# Altium schematic sheet Main.SchDoc: ТО2429
size 410 x 297 mm; ApprovedBy: Стерхов В.Д.; CheckedBy: Стерхов В.Д.; Author: Сергеев Д.А.; CompanyName: ГК "СНАБЖЕНИЕ"; DrawnBy: Сергеев Д.А.; Engineer: Сергеев Д.А.; Organization: ГК "СНАБЖЕНИЕ"; DocumentNumber: ТО2429; Revision: 1; SheetNumber: 1; SheetTotal: 2
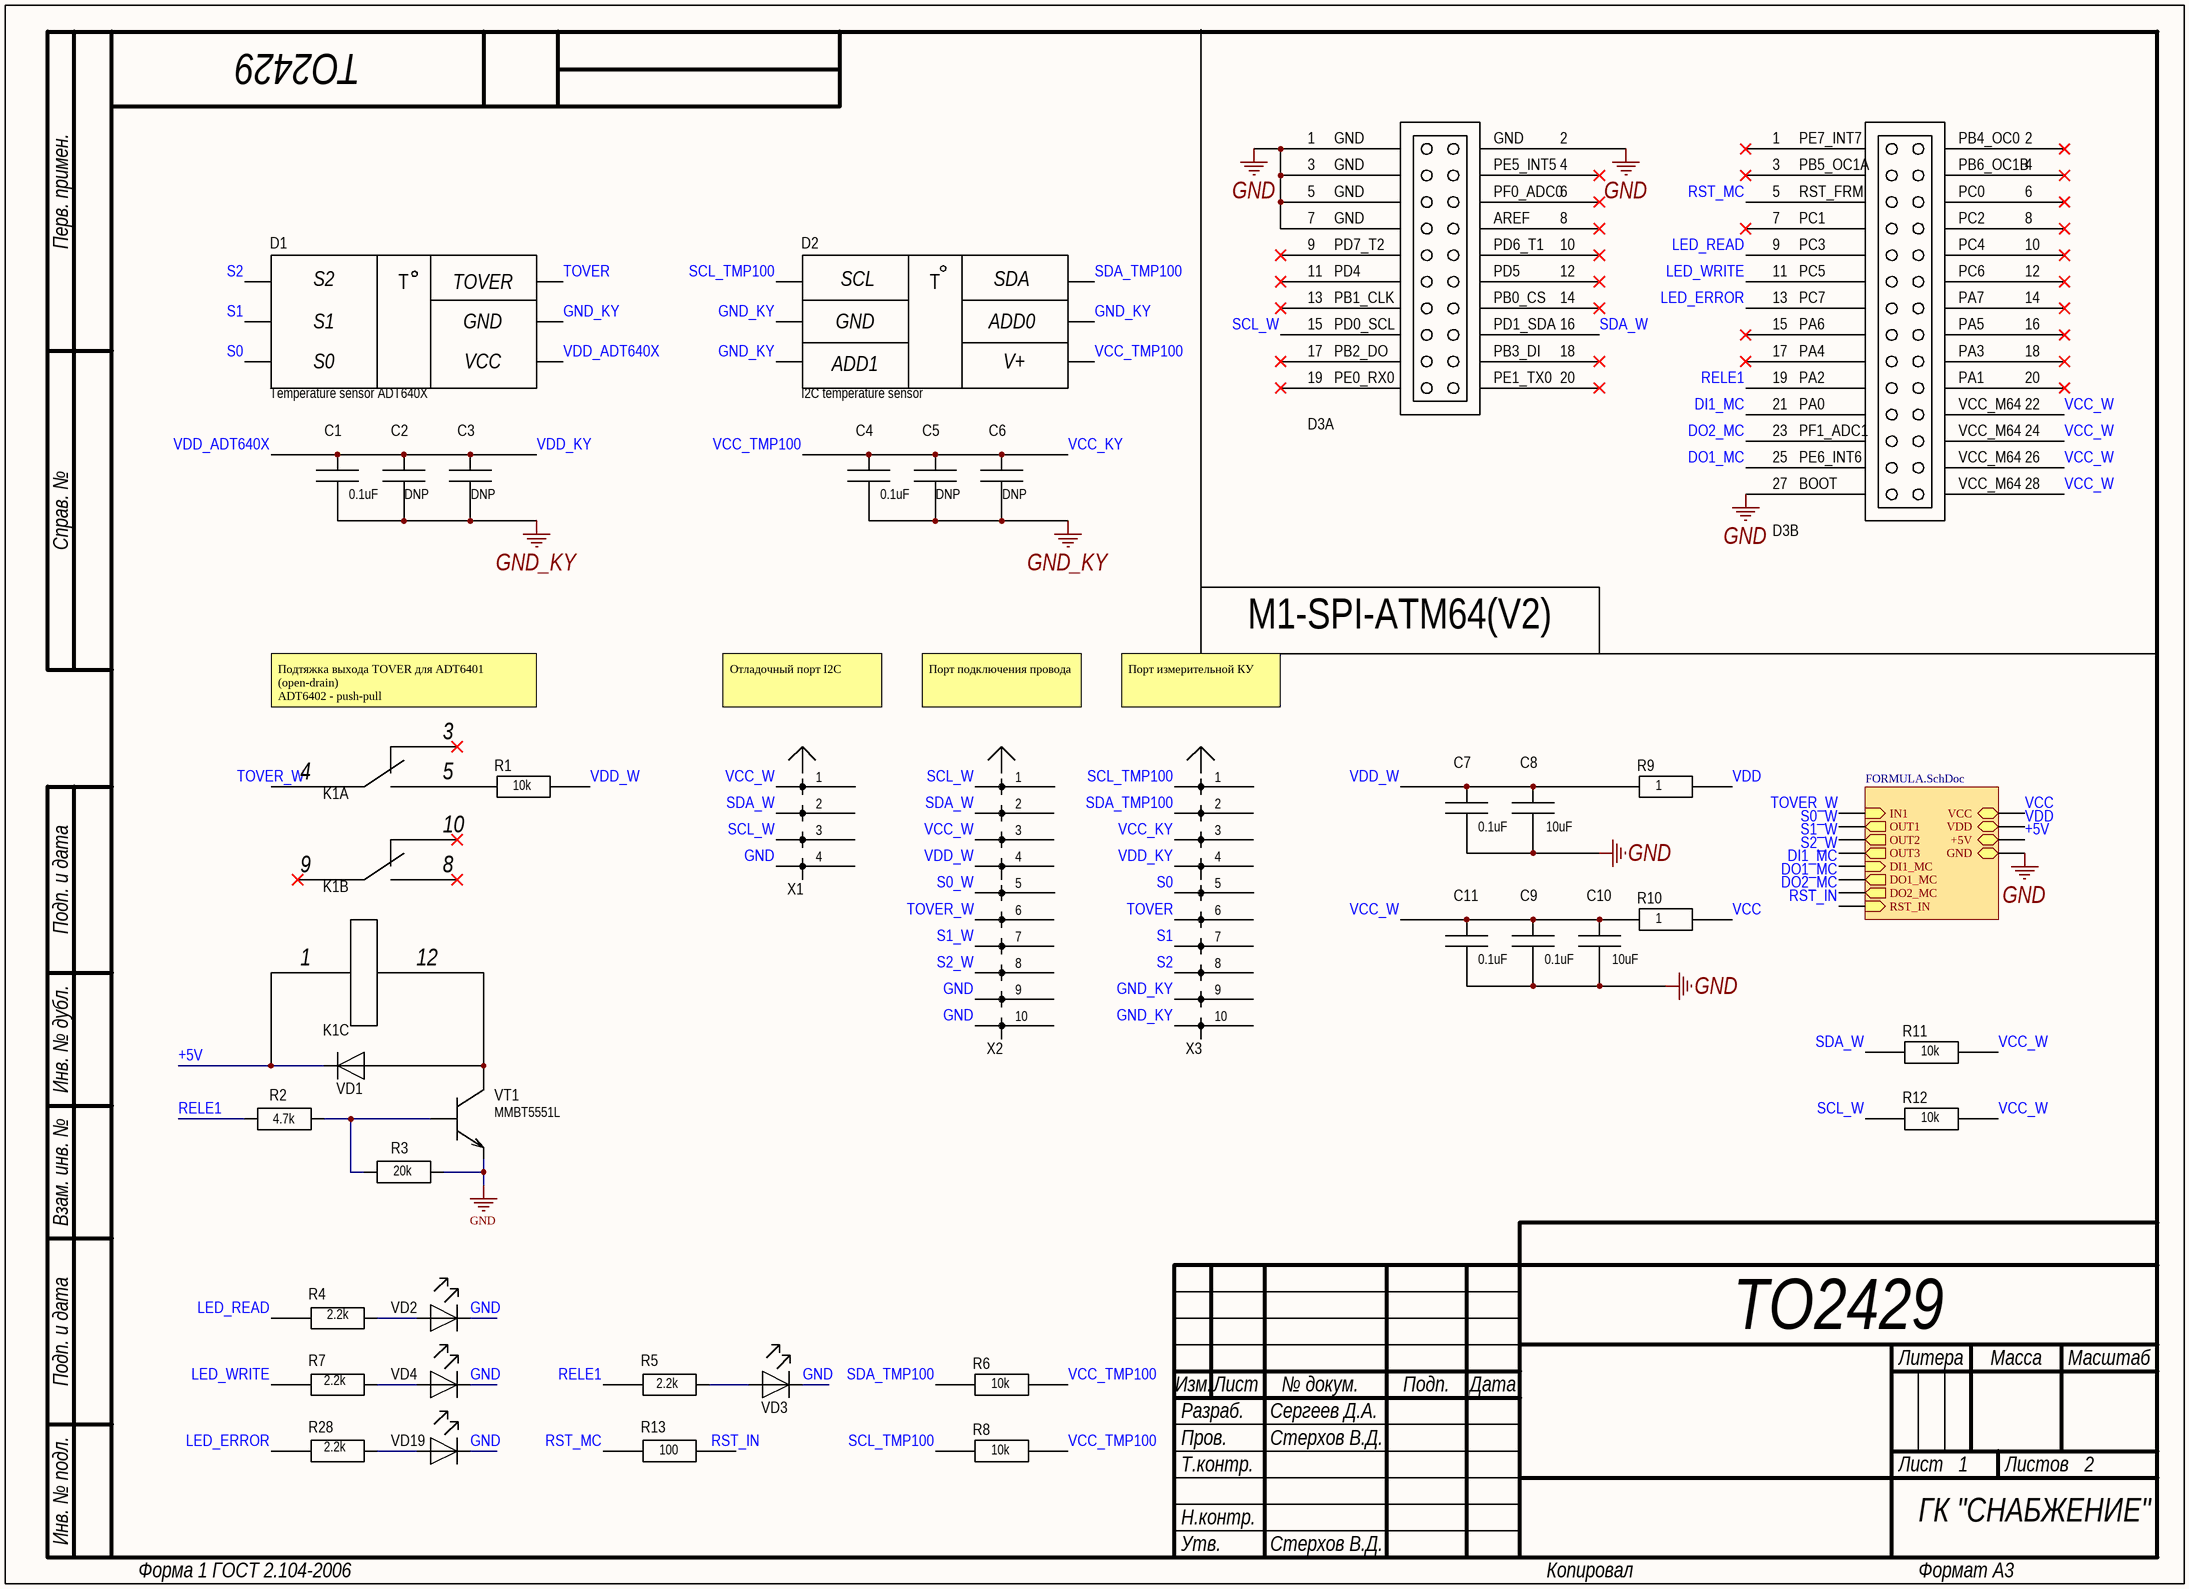
[diagram p0: Main.SchDoc]

## Parts
C1  0.1uF  [0603]
C2  DNP  [0603]
C3  DNP  [0603]
C4  0.1uF  [0603]
C5  DNP  [0603]
C6  DNP  [0603]
C7  0.1uF  [0805]
C8  10uF  [0805]
C9  0.1uF  [0805]
C10  10uF  [0805]
C11  0.1uF  [0805]
D1  Temperature sensor ADT640X  [SOT-23-6 to DIP 7.62]
D2  I2C temperature sensor  [SOT23-6]
D3  M1-SPI-ATM64(V2)  [M1-SPI-ATM64(V2)]  (value not drawn)  (parts A,B of 2)
K1  V23079A1001B301 TE  [V23079A1001B301]  (value not drawn)  (parts A,B,C of 3)
R1  10k  [0805]
R2  4.7k  [0805]
R3  20k  [0805]
R4  2.2k  [0805]
R5  2.2k  [0805]
R6  10k  [0603]
R7  2.2k  [0805]
R8  10k  [0603]
R9  1  [0805]
R10  1  [0805]
R11  10k  [0805]
R12  10k  [0805]
R13  100  [0805]
R28  2.2k  [0805]
VD1  LL4148 NXP  [SOD80C]  (value not drawn)
VD2  LED(0805)  [0805(LED)]  (value not drawn)
VD3  LED(0805)  [0805(LED)]  (value not drawn)
VD4  LED(0805)  [0805(LED)]  (value not drawn)
VD19  LED(0805)  [0805(LED)]  (value not drawn)
VT1  MMBT5551L  [SOT-23]
X1  PLS4-2,54  [PLS4-2,54]  (value not drawn)
X2  PLD10-2,54  [PLD10-2,54]  (value not drawn)
X3  PLD10-2,54  [PLD10-2,54]  (value not drawn)

## Sub-sheets
? = FORMULA.SchDoc: OUT1 (out), VDD (bidir), VCC (bidir), +5V (bidir), OUT3 (out), IN1 (in), OUT2 (out), GND (bidir), DO1_MC (out), DI1_MC (in), DO2_MC (out), RST_IN (in)

## Nets
GND: C7.2 C8.2 C9.2 C10.2 C11.2 D3.1X2 D3.2X2 D3.3X2 D3.5X2 D3.7X2 D3.27X3 R3.2 VD2.2(K) VD3.2(K) VD4.2(K) VD19.2(K) VT1.2(E) X1.4 X2.9 X2.10 ; sheet /GND
GND_KY: C1.2 C2.2 C3.2 C4.2 C5.2 C6.2 D1.5 D2.2 D2.3 D2.5 X3.9 X3.10
+5V: K1.1 VD1.2(K) ; sheet /+5V
DI1_MC: D3.21X3 ; sheet /DI1_MC
DO1_MC: D3.25X3 ; sheet /DO1_MC
DO2_MC: D3.23X3 ; sheet /DO2_MC
LED_ERROR: D3.13X3 R28.1
LED_READ: D3.9X3 R4.1
LED_WRITE: D3.11X3 R7.1
RELE1: D3.19X3 R2.1 R5.1
RST_IN: R13.2 ; sheet /RST_IN
RST_MC: D3.5X3 R13.1
S0: D1.3 X3.5
S0_W: X2.5 ; sheet /OUT1
S1: D1.2 X3.7
S1_W: X2.7 ; sheet /OUT2
S2: D1.1 X3.8
S2_W: X2.8 ; sheet /OUT3
SCL_TMP100: D2.1 R8.1 X3.1
SCL_W: D3.15X2 R12.1 X1.3 X2.1
SDA_TMP100: D2.6 R6.1 X3.2
SDA_W: D3.16X2 R11.1 X1.2 X2.2
TOVER: D1.6 X3.6
TOVER_W: K1.4 X2.6 ; sheet /IN1
VCC: R10.2 ; sheet /VCC
VCC_KY: C4.1 C5.1 C6.1 D2.4 R6.2 R8.2 X3.3  [also labelled VCC_TMP100]
VCC_W: C9.1 C10.1 C11.1 D3.22X3 D3.24X3 D3.26X3 D3.28X3 R10.1 R11.2 R12.2 X1.1 X2.3
VDD: R9.2 ; sheet /VDD
VDD_ADT640X: C1.1 C2.1 C3.1 D1.4 X3.4  [also labelled VDD_KY]
VDD_W: C7.1 C8.1 R1.2 R9.1 X2.4
NetK1_5: K1.5 R1.1
NetK1_12: K1.12 VD1.1(A) VT1.3(K)
NetR2_2: R2.2 R3.1 VT1.1(B)
NetR4_2: R4.2 VD2.1(A)
NetR5_2: R5.2 VD3.1(A)
NetR7_2: R7.2 VD4.1(A)
NetR28_2: R28.2 VD19.1(A)

Not connected (* = marked no-connect by the designer): D3 1X3* 2X3* 3X3* 4X2* 4X3* 6X2* 6X3* 7X3* 8X2* 8X3* 9X2* 10X2* 10X3* 11X2* 12X2* 12X3* 13X2* 14X2* 14X3* 15X3* 16X3* 17X2* 17X3* 18X2* 18X3* 19X2* 20X2* 20X3*; K1 3* 8* 9* 10*

## Notes on the sheet
- M1-SPI-ATM64(V2)
- (near K1) Подтяжка выхода TOVER для ADT6401 (open-drain)
  ADT6402 - push-pull
- Отладочный порт I2C
- Порт подключения провода
- Порт измерительной КУ
- Перв. примен.
- Справ. №
- Подп. и дата
- Инв. № дубл.
- Взам. инв. №
- Разраб.
- Изм.
- Лист
- № докум.
- Подп.
- Дата
- Литера
- Масса
- Масштаб
- Пров.
- Т.контр.
- Листов
- Инв. № подл.
- Н.контр.
- Утв.
- Форма 1 ГОСТ 2.104-2006
- Копировал
- Формат А3
- (in symbol ADT6402) S2; T; TOVER; S1; GND; S0; VCC
- (in symbol M1-SPI-ATM64(V2), part A) GND; 3; PE5_INT5; 4; 5; PF0_ADC0; 6; 7; AREF; 8; 9; PD7_T2; PD6_T1; 10; 11; PD4; PD5; 12; 13; PB1_CLK; PB0_CS; 14; 15; PD0_SCL; PD1_SDA; 16; 17; PB2_DO; PB3_DI; 18; 19; PE0_RX0; PE1_TX0; 20
- (in symbol M1-SPI-ATM64(V2), part B) PE7_INT7; PB4_OC0; 3; PB5_OC1A; PB6_OC1B; 4; 5; RST_FRM; PC0; 6; 7; PC1; PC2; 8; 9; PC3; PC4; 10; 11; PC5; PC6; 12; 13; PC7; PA7; 14; 15; PA6; PA5; 16; 17; PA4; PA3; 18; 19; PA2; PA1; 20; 21; PA0; VCC_M64; 22; 23; PF1_ADC1; 24; 25; PE6_INT6; 26; 27; BOOT; 28
- (in symbol TMP100) SCL; T; SDA; GND; ADD0; ADD1; V+

## Library data of the parts
C1-C6 = C0603: ComponentHeigt: 1.3; Firme: AVX; Leadform: SMD; KIND: Конденсатор; ClassName: *; Component Link: *; ComponentWeigt: *; Packaging: 0805; NN: *; Value: *
C7-C11 = C0805: ComponentHeigt: 1.3; Firme: AVX; Leadform: SMD; KIND: Конденсатор; ClassName: *; Component Link: *; ComponentWeigt: *; Packaging: 0805; NN: *; Value: *
D1 = ADT6402
D2 = TMP100
D3 = M1-SPI-ATM64(V2): ComponentHeigt: 5.5; Name: Вилка; Specification: Вилка PLD2-2 *; Typ: PLD2-2; ClassName: *; Component Link: *; ComponentWeigt: *; Firme: *; Leadform: *; NN: *; KIND: *
R1-R5 R7 R9-R13 = R0805 Yageo: ComponentHeigt: 0.6; Firme: Yageo; Leadform: SMD; Kind: Резистор; ClassName: *; ComponentWeigt: *; Component Link: *; Packaging: 0805; NN: *; Value: *
R6 R8 = R0603 Yageo: ComponentHeigt: 0.5; Firme: Yageo; Leadform: SMD; Kind: Резистор; ClassName: *; Component Link: *; Packaging: 0402; NN: *
R28 = R0805 Yageo: RED; ComponentHeigt: 0.6; Firme: Yageo; Leadform: SMD; Kind: Резистор; ClassName: *; ComponentWeigt: *; Component Link: *; Packaging: 0805; NN: *; Value: *
VD1 = LL4148 NXP: ComponentHeigt: 1.6; Leadform: SMD; NN: 24009301; KIND: Диод LL4148 NXP; Component Link: http://www.nxp.com; Packaging: SOD-80C; ClassName: *; Firme: NXP
VD2-VD4 VD19 = LED(0805): ComponentHeigt: 0.75; Leadform: в отверстия; Firme: Kingbright; NN: 24003000; KIND: Светодиод L-1154GD Kingbright; Component Link: *; ClassName: *
VT1 = MMBT5551L: ComponentHeigt: 1.1; Firme: ONS; Leadform: SMD; NN: 24007468; KIND: Транзистор MMBT5551L*G ONS; ClassName: *; ComponentWeigt: *; Packaging: SOT-23
X1 = PLS4-2,54: ComponentHeigt: 5.5; Name: Вилка; Specification: Вилка PLD2-2 *; Typ: PLD2-2; ClassName: *; Component Link: *; ComponentWeigt: *; Firme: *; Leadform: *; NN: *; KIND: *
X2 X3 = PLD10-2,54: ComponentHeigt: 5.5; Name: Вилка; Specification: Вилка PLD2-2 *; Typ: PLD2-2; ClassName: *; Component Link: *; ComponentWeigt: *; Firme: *; Leadform: *; NN: *; KIND: *